# EAGLE design tranc_1c (EAGLE 6.5.0)
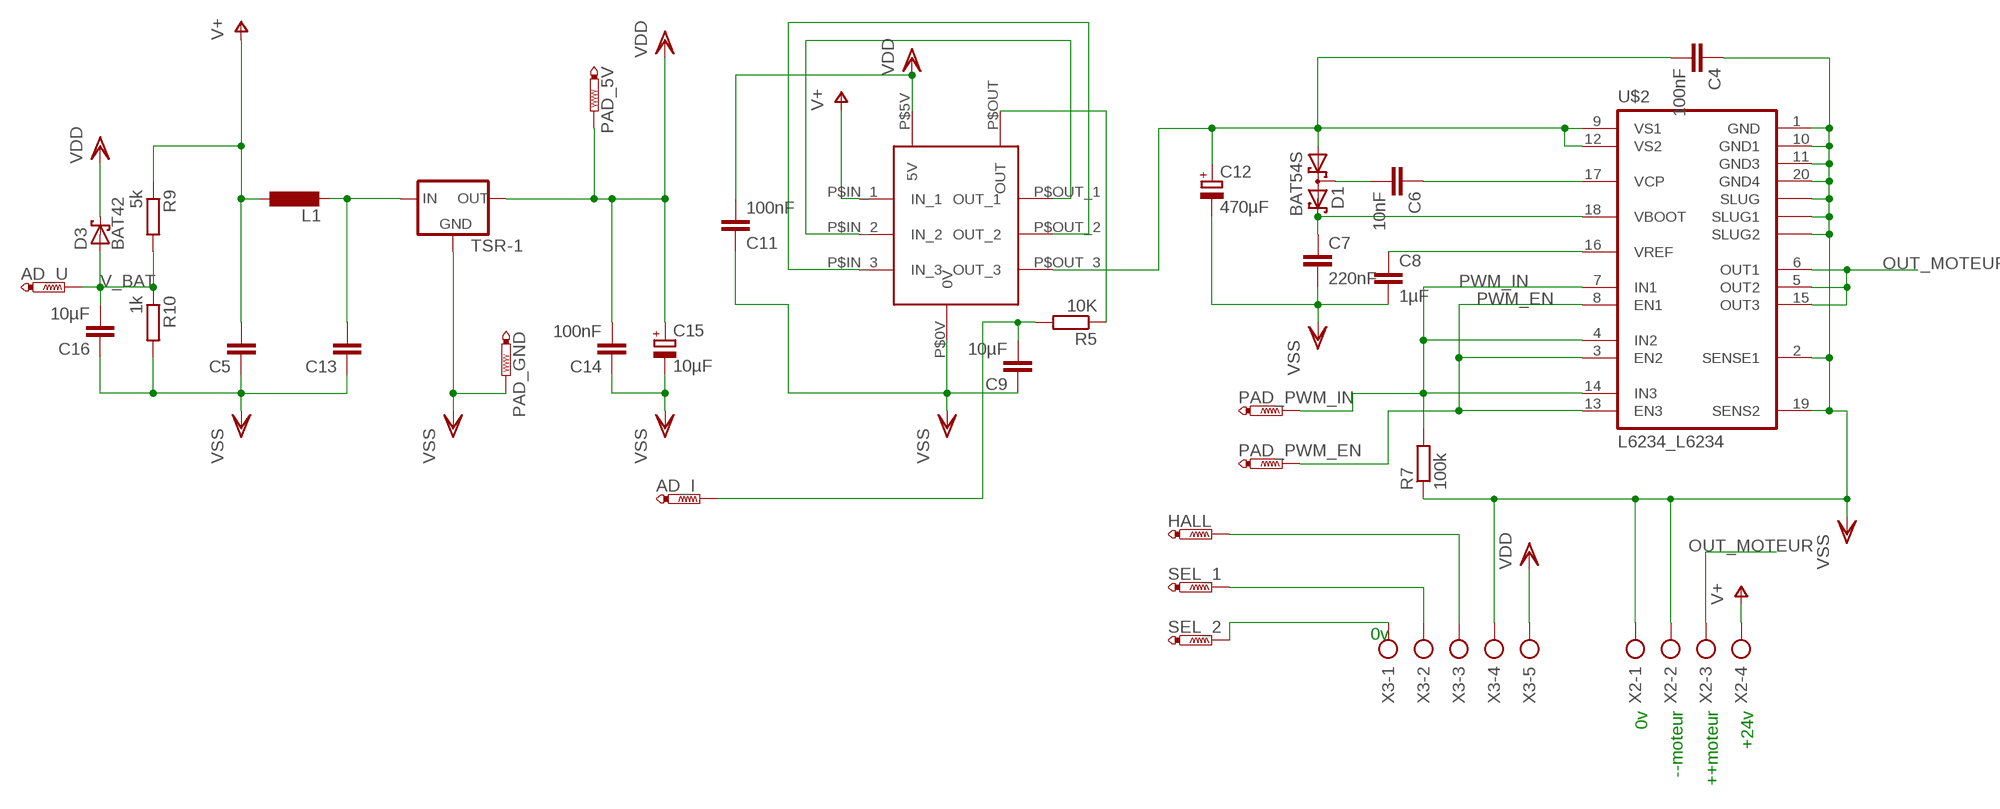
[diagram p0: schematic, sheet 1]

## Parts
AD_I  PTR1TP20SQ  [TP20SQ]
AD_U  PTR1TP20SQ  [TP20SQ]
C4  100nF  C-EUC0805K  [C0805K]
C5  C-EUC1206K  [C1206K]
C6  10nF  C-EUC0805K  [C0805K]
C7  220nF  C-EUC0805K  [C0805K]
C8  1µF  C-EUC0805K  [C0805K]
C9  10µF  C-EUC1812  [C1812]
C11  100nF  C-EUC0805K  [C0805K]
C12  470µF  CPOL-EUTT5D11L  [TT5D11L]
C13  C-EUC1206K  [C1206K]
C14  100nF  C-EUC0805K  [C0805K]
C15  10µF  CPOL-EUSMCB  [SMC_B]
C16  10µF  C-EUC0805K  [C0805K]
D1  BAT54S  [SOT23]
D3  BAT42  [DO35-10]
HALL  PTR1TP20SQ  [TP20SQ]
L1  L-EUL2012C  [L2012C]
PAD_5V  PTR1TP20SQ  [TP20SQ]
PAD_GND  PTR1TP20SQ  [TP20SQ]
PAD_PWM_EN  PTR1TP20SQ  [TP20SQ]
PAD_PWM_IN  PTR1TP20SQ  [TP20SQ]
R5  10K  R-EU_M0805  [M0805]
R7  100k  R-EU_M0805  [M0805]
R9  5k  R-EU_M0805  [M0805]
R10  1k  R-EU_M0805  [M0805]
SEL_1  PTR1TP20SQ  [TP20SQ]
SEL_2  PTR1TP20SQ  [TP20SQ]
TSR-1  78XXS  [78XXS]
U$1  LTS25-NP  [LTS25]
U$2  L6234_L6234  [L6234_SO20POWER2]
X2  AK300/4  [AK300/4]
X3  AK300/5  [AK300/5]

## Nets
N$1: C13.2 L1.2 TSR-1.IN
N$2: U$1.P$IN_2(IN_2) U$1.P$OUT_1(OUT_1)
N$3: HALL.TP X3.3
N$4: SEL_1.TP X3.2
N$5: U$1.P$IN_3(IN_3) U$1.P$OUT_2(OUT_2)
N$6: SEL_2.TP X3.1
N$7: C4.2 C12.+ D1.1(A1) U$1.P$OUT_3(OUT_3) U$2.9(VS1) U$2.12(VS2)
N$8: R5.1 U$1.P$OUT(OUT)
N$10: C6.2 D1.3(C1A2)
N$11: C6.1 U$2.17(VCP)
N$12: C7.1 D1.2(C2) U$2.18(VBOOT)
N$13: C8.1 U$2.16(VREF)
N$30: AD_I.TP C9.2 R5.2
OUT_MOTEUR: U$2.5(OUT2) U$2.6(OUT1) U$2.15(OUT3) X2.3
PWM_EN: PAD_PWM_EN.TP U$2.3(EN2) U$2.8(EN1) U$2.13(EN3)
PWM_IN: PAD_PWM_IN.TP R7.2 U$2.4(IN2) U$2.7(IN1) U$2.14(IN3)
V+: C5.2 L1.1 R9.1 U$1.P$IN_1(IN_1) X2.4
V_BAT: AD_U.TP C16.2 D3.A R9.2 R10.1
VDD: C11.2 C14.2 C15.+ D3.C PAD_5V.TP TSR-1.OUT U$1.P$5V(5V) X3.5
VSS: C4.1 C5.1 C7.2 C8.2 C9.1 C11.1 C12.- C13.1 C14.1 C15.- C16.1 PAD_GND.TP R7.1 R10.2 TSR-1.GND U$1.P$0V(0V) U$2.1(GND) U$2.2(SENSE1) U$2.10(GND1) U$2.11(GND3) U$2.19(SENS2) U$2.20(GND4) U$2.SLUG1(SLUG2) U$2.SLUG2(SLUG) U$2.SLUG(SLUG1) X2.1 X2.2 X3.4

## Notes on the sheet
- 0v
- 0v | --moteur | ++moteur | +24v

## Library data of the parts
AD_I AD_U HALL PAD_5V PAD_GND PAD_PWM_EN PAD_PWM_IN SEL_1 SEL_2 = testpad:PTR1: TEST PIN
C4-C9 C11 C13 C14 C16 = rcl:C-EU: CAPACITOR, European symbol
C12 C15 = rcl:CPOL-EU: POLARIZED CAPACITOR, European symbol
D1 = diode:BAT54S: Schottky Diodes Pin connection corrected 2011-05-04 Source: Fairchild .. BAT54.pdf
D3 = diode:BAT42: DIODE barrier diode
L1 = rcl:L-EU: INDUCTOR, European symbol
R5 R7 R9 R10 = rcl:R-EU_: RESISTOR, European symbol
TSR-1 = v-reg:78XXS: VOLTAGE REGULATOR
U$1 = lem:LTS25-NP
U$2 = 009:L6234_L6234
X2 = con-ptr500:AK300/4: CONNECTOR; OC_FARNELL: unknown; OC_NEWARK: unknown
X3 = con-ptr500:AK300/5: CONNECTOR; OC_FARNELL: unknown; OC_NEWARK: unknown

## Board
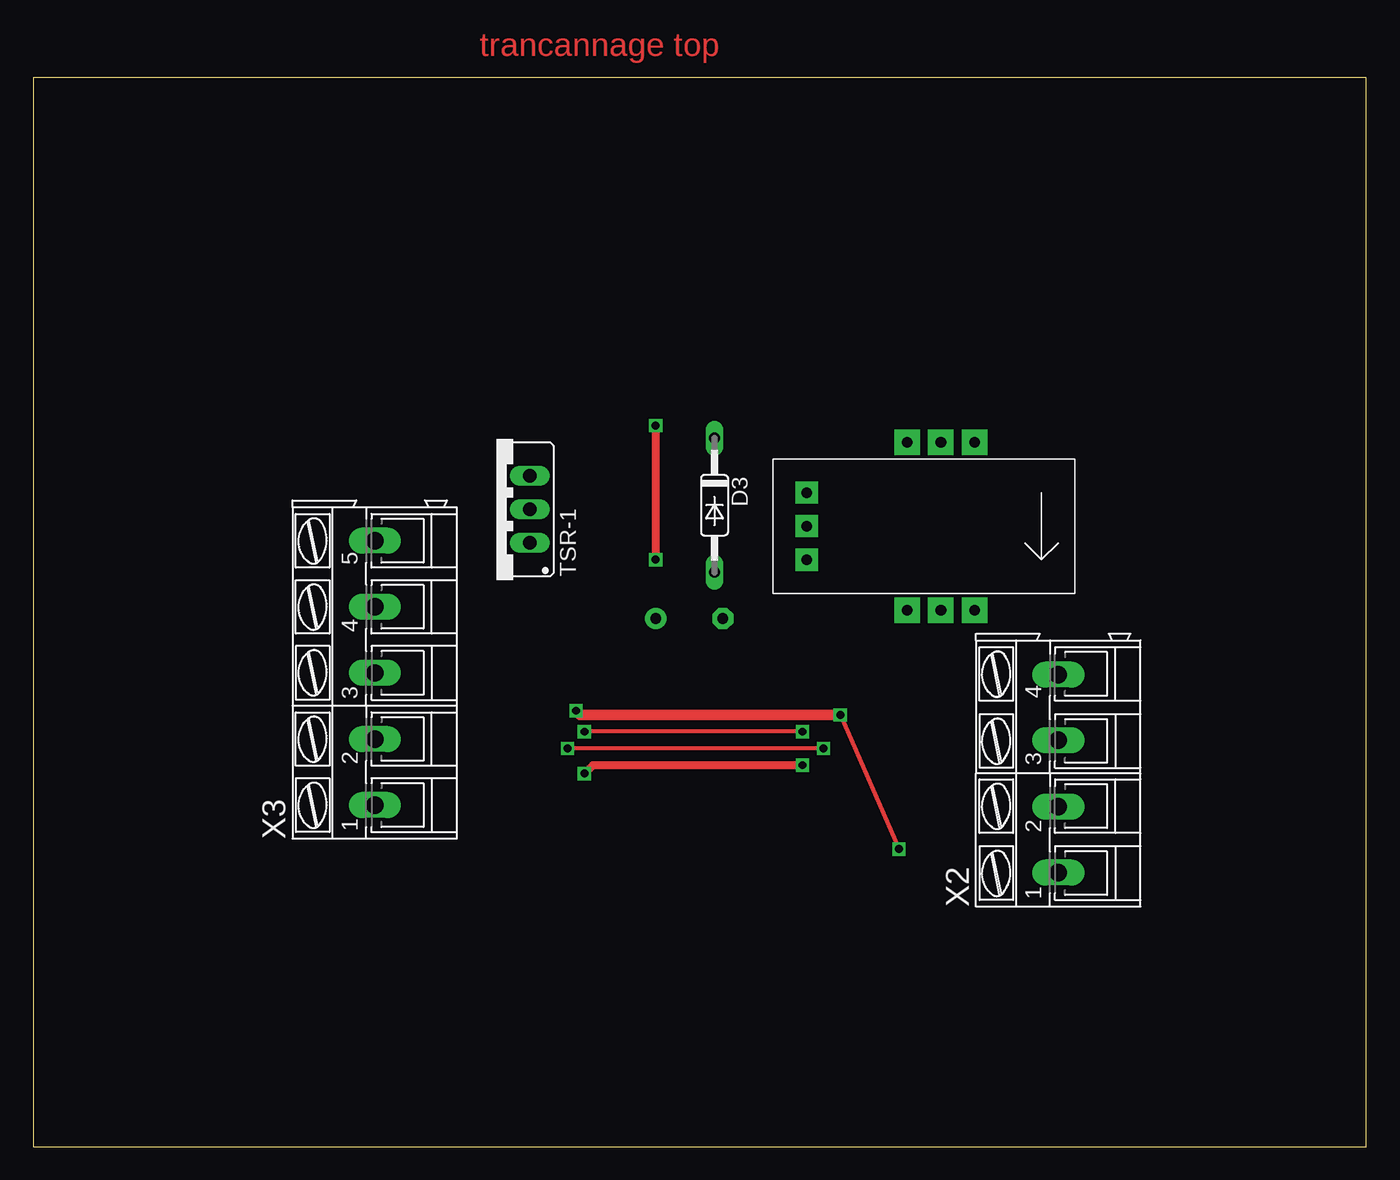
[diagram p1: board, top side]
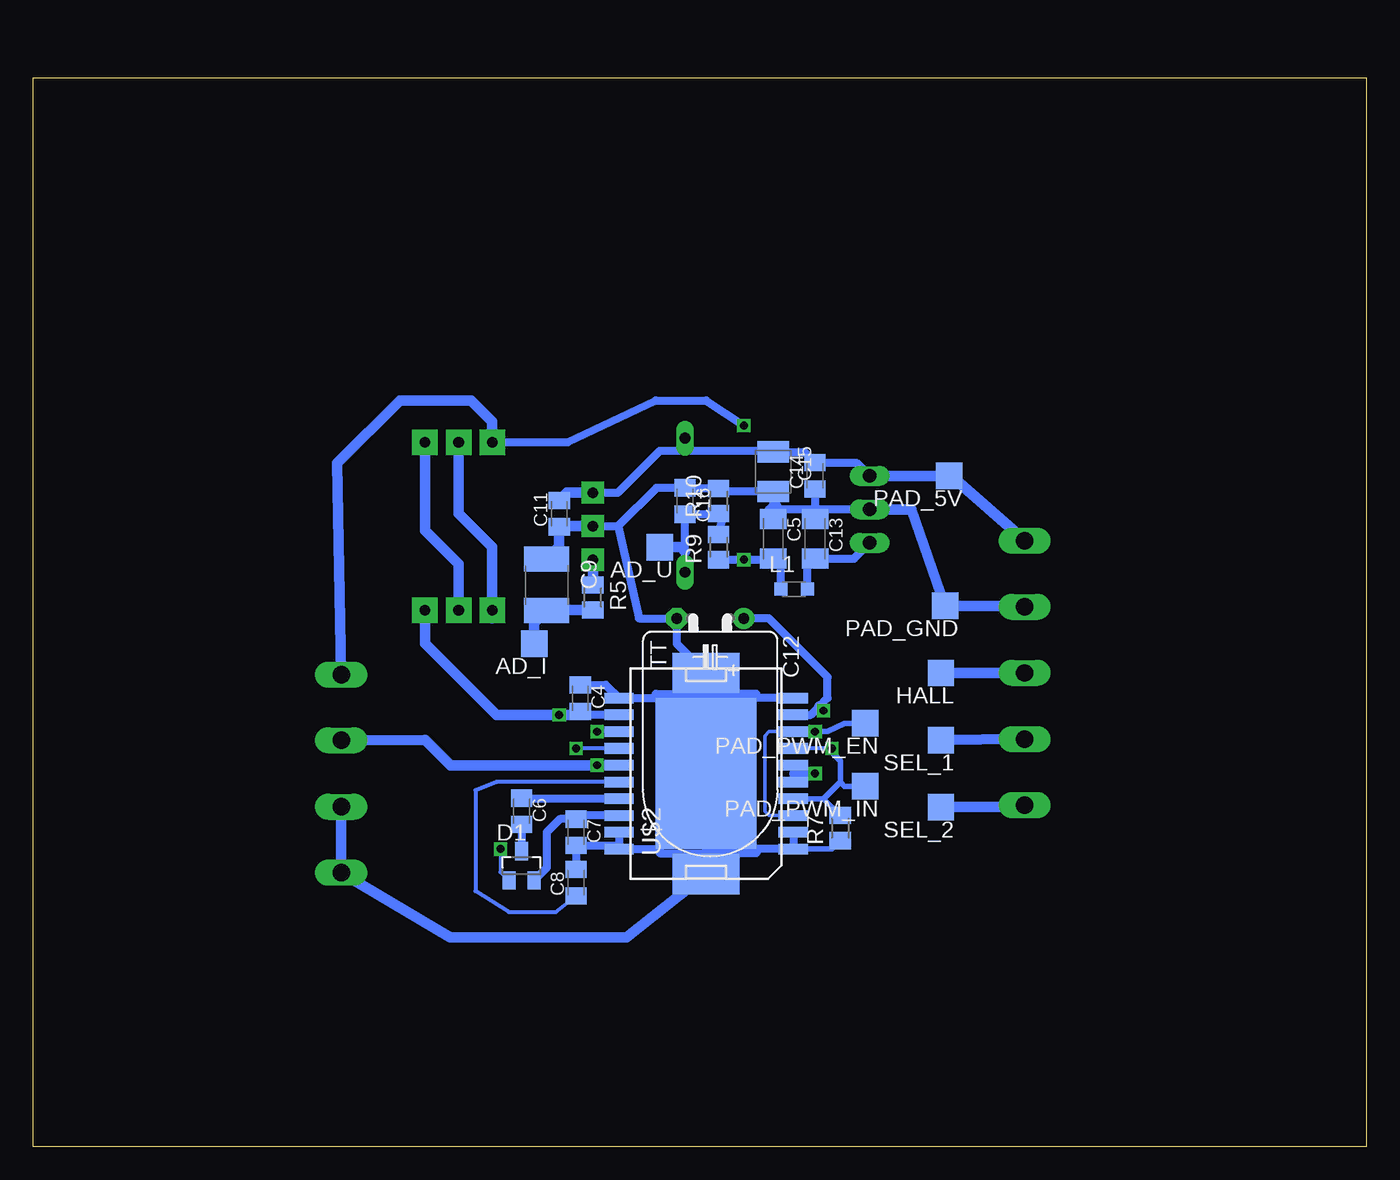
[diagram p2: board, bottom side, seen from below]

Size 100.95 x 80.95 mm. Coordinates in mm from the lower left corner, seen from the top.
Outline: 0,0 100.95,0 100.95,80.95 0,80.95 0,0
Copper layers (1*16): Top 0.035mm / dielectric 1.5mm / Bottom 0.035mm
Design rules "default": minimum track width 10mil, minimum drill 24mil, track to track 8mil, track to pad 8mil, pad to pad 8mil, via to via 8mil, smd to smd 8mil, copper to edge 40mil, drill to drill 8mil, minimum pad ring 10mil, minimum via ring 8mil, stop-mask expansion 4mil, vias tented up to drill 0mil, thermal gap 10mil

### Footprints (pad centres in the part's own frame; a part is rotated, then mirrored left to right if it is on the bottom)
TP20SQ = smd 2 x 2: TP 0,0
C0805K = smd 1.3 x 1.6: 1 -1,0; 2 1,0
C1206K = smd 1.5 x 2: 1 -1.5,0; 2 1.5,0
C1812 = smd 1.9 x 3.4: 1 -1.95,0; 2 1.95,0
TT5D11L = drill 0.813 pad 1.6: + -2.54,0 | drill 0.813 pad 1.6 octagon: - 2.54,0
SMC_B = smd 1.6 x 2.4: + -1.5,0; - 1.5,0
SOT23 = smd 1 x 1.4: 1 -0.95,-1.1; 2 0.95,-1.1; 3 0,1.1
DO35-10 = drill 0.813 long: A 5.08,0; C -5.08,0
L2012C = smd 1 x 1: 1 -1,0; 2 1,0
M0805 = smd 1.3 x 1.6: 1 -0.95,0; 2 0.95,0
78XXS = drill 1.016 long: GND 0,-2.54; IN -2.54,-2.54; OUT 2.54,-2.54
LTS25 = drill 0.8 pad 1.676 square: P$0V -10.16,0; P$5V -10.16,2.54; P$OUT -10.16,-2.54 | drill 0.8 pad 1.93 square: P$IN_1 -2.54,6.35; P$IN_2 0,6.35; P$IN_3 2.54,6.35; P$OUT_1 -2.54,-6.35; P$OUT_2 0,-6.35; P$OUT_3 2.54,-6.35
L6234_SO20POWER2 = smd 0.8 x 2.2: 1 -5.715,-6.6; 2 -4.445,-6.6; 3 -3.175,-6.6; 4 -1.905,-6.6; 5 -0.635,-6.6; 6 0.635,-6.6; 7 1.905,-6.6; 8 3.175,-6.6; 9 4.445,-6.6; 10 5.715,-6.6; 11 5.715,6.6; 12 4.445,6.6; 13 3.175,6.6; 14 1.905,6.6; 15 0.635,6.6; 16 -0.635,6.6; 17 -1.905,6.6; 18 -3.175,6.6; 19 -4.445,6.6; 20 -5.715,6.6 | smd 3.048 x 5.08: SLUG -7.62,0; SLUG2 7.62,0 | smd 11.43 x 7.62: SLUG1 0,0
AK300/4 = drill 1.321 long: 1 -7.493,0; 2 -2.515,0; 3 2.515,0; 4 7.493,0
AK300/5 = drill 1.321 long: 1 -10.008,0; 2 -5.004,0; 3 0,0; 4 5.004,0; 5 10.008,0

### Placement (x,y rotation side)
AD_I  63.02,38.1 180 bottom
AD_U  53.49,45.4 180 bottom
C4  59.52,33.97 270 bottom
C5  44.92,46.03 270 bottom
C6  63.97,25.39 270 bottom
C7  59.84,23.81 270 bottom
C8  59.84,20 90 bottom
C9  62.06,42.54 270 bottom
C11  61.11,47.94 90 bottom
C12  49.68,40 180 bottom
C13  41.74,46.03 270 bottom
C14  41.74,50.8 90 bottom
C15  44.92,51.11 270 bottom
C16  51.59,48.89 270 bottom
D1  63.97,21.27 0 bottom
D3  51.59,48.57 270 top
HALL  32.22,35.87 180 bottom
L1  43.33,42.22 0 bottom
PAD_5V  31.58,50.8 180 bottom
PAD_GND  31.9,40.95 180 bottom
PAD_PWM_EN  37.94,32.06 180 bottom
PAD_PWM_IN  37.94,27.3 180 bottom
R5  58.57,41.59 270 bottom
R7  39.84,24.12 90 bottom
R9  49.05,45.4 90 bottom
R10  49.05,48.89 90 bottom
SEL_1  32.22,30.79 180 bottom
SEL_2  32.22,25.71 180 bottom
TSR-1  35.08,48.26 90 top
U$1  68.73,46.98 0 top
U$2  50,28.25 90 bottom
X2  77.62,28.25 90 top
X3  25.87,35.87 90 top

### Tracks (layer width: path | path; a pad name or v marks a point on that pad's centre or on a via)
N$1
  Bottom 0.61: TSR-1.IN 38.8,44.53 C13.2 42.33,43.95 L1.2
N$2
  Bottom 0.813: U$1.P$IN_2 68.73,47.94 66.19,45.4 U$1.P$OUT_1 66.19,40
N$3
  Bottom 0.813: HALL.TP X3.3
N$4
  Bottom 0.813: SEL_1.TP 32.46,30.79 X3.2
N$5
  Bottom 0.813: U$1.P$IN_3 71.27,46.67 68.73,44.13 U$1.P$OUT_2
N$6
  Bottom 0.813: SEL_2.TP 25.08,25.71 X3.1
N$7  (via drill 0.6)
  Top 0.305: v61.11,32.7 v65.56,22.54
  Top 0.813: v61.11,32.7 41.43,32.7 v41.11,33.02
  Bottom 0.305: v65.56,22.54 65.56,20.8 D1.1
  Bottom 0.61: U$2.12 59.25,32.7 C4.2 | U$2.9 42.06,32.7 41.43,33.33 40.79,33.97 40.79,35.55 45.24,40 C12.+
  Bottom 0.813: 59.25,32.7 v61.11,32.7 65.88,32.7 71.27,38.1 U$1.P$OUT_3 | v41.11,33.02 41.43,33.33
N$8
  Bottom 0.813: U$1.P$OUT R5.1
N$10
  Bottom 0.61: C6.2 D1.3
N$11
  Bottom 0.61: U$2.17 63.97,26.35 C6.1
N$12
  Bottom 0.61: U$2.18 59.57,25.08 C7.1 61.06,24.81 62.06,23.81 62.06,21.12 D1.2
N$13
  Bottom 0.305: U$2.16 65.88,27.62 67.46,26.98 67.46,19.36 64.92,17.77 61.38,17.77 C8.1
N$30
  Bottom 0.813: R5.2 62.02,40.64 C9.2 63.02,39.64 AD_I.TP
OUT_MOTEUR  (via drill 0.6)
  Top 0.61: v58.25,28.89 42.38,28.89 v41.74,28.25
  Bottom 0.61: U$2.6 43.4,28.25 | 43.4,28.25 U$2.5 | U$2.15 v58.25,28.89 | v41.74,28.25 43.4,28.25
  Bottom 0.813: X2.3 71.27,30.79 69.34,28.86 58.28,28.86 v58.25,28.89
PWM_EN  (via drill 0.6)
  Top 0.305: v58.25,31.43 v41.74,31.43
  Bottom 0.254: U$2.3 45.24,25.08 45.55,25.39 45.55,31.11 45.24,31.43 U$2.8
  Bottom 0.305: U$2.13 v58.25,31.43 | v41.74,31.43 U$2.8
  Bottom 0.406: v41.74,31.43 40.79,31.43 39.52,32.06 PAD_PWM_EN.TP
PWM_IN  (via drill 0.6)
  Top 0.305: v59.84,30.16 v40.48,30.16
  Bottom 0.305: U$2.14 v59.84,30.16 | U$2.7 v40.48,30.16 40.48,29.84
  Bottom 0.406: U$2.4 41.11,26.35 | 41.11,26.35 R7.2 | 40.48,29.84 39.84,29.2 39.84,27.62 | 39.84,27.62 41.11,26.35 | PAD_PWM_IN.TP 39.52,27.3 39.84,27.62
V+  (via drill 0.6)
  Top 0.61: v47.14,54.61 v47.14,44.45
  Bottom 0.61: R9.1 v47.14,44.45 45,44.45 C5.2 44.33,43.95 L1.1 | U$1.P$IN_1 60.48,53.34 53.81,56.51 50,56.51 v47.14,54.61
  Bottom 0.813: X2.4 77.94,51.75 73.18,56.51 67.78,56.51 66.19,54.92 U$1.P$IN_1
V_BAT
  Bottom 0.61: R9.2 48.73,47.62 R10.1 49.1,47.89 C16.2 51.59,45.08 D3.A
  Bottom 0.813: AD_U.TP 51.91,45.4 51.59,45.08
VDD
  Bottom 0.61: 37.94,51.11 TSR-1.OUT 38.62,51.8 C14.2 42.56,52.61 C15.+ 45.01,52.7 51.59,52.7 | U$1.P$5V 56.67,49.53 53.49,52.7 51.59,52.7 | D3.C 51.59,52.7
  Bottom 0.813: U$1.P$5V 60.52,49.53 C11.2 | TSR-1.OUT PAD_5V.TP 31.42,50.8 X3.5
VSS
  Bottom 0.406: U$2.1 40.48,22.54 R7.1
  Bottom 0.61: U$2.19 U$2.20 | U$2.2 U$2.1 46.19,22.54 46.19,22.22 50,22.22 | U$2.20 53.49,22.54 53.49,22.22 50,22.22 | 50,22.22 U$2.SLUG | 50,34.29 53.81,34.29 53.81,33.97 U$2.11 57.6,34.97 C4.1 | U$2.10 46.51,33.97 46.19,34.29 50,34.29 | 50,34.29 U$2.SLUG2 52.22,38.1 C12.- 55.08,40 56.67,46.98 | U$2.20 56.87,22.81 C7.2 C8.2 | 50,22.22 U$2.SLUG1 50,34.29 | U$1.P$0V 56.67,46.98 | TSR-1.GND 41.74,48.26 | 41.74,48.26 44.6,48.26 | 44.6,48.26 44.92,48.57 | C5.1 44.92,47.94 44.6,48.26 | C13.1 41.74,48.26 | C14.1 41.74,48.26 | 44.92,48.57 C15.- 48.82,49.61 R10.2 49.1,49.89 C16.1 53.76,49.89 56.67,46.98 | 44.92,48.57 45.24,48.26 44.92,48.26 44.6,48.57 44.92,48.57
  Bottom 0.813: U$2.SLUG 56.03,15.87 69.37,15.87 77.11,20.44 X2.1 X2.2 | U$1.P$0V 61.06,46.98 C11.1 61.11,45.44 C9.1 | TSR-1.GND 34.44,48.26 PAD_GND.TP 25.63,40.95 X3.4

### Text on the board
Top: trancannage top
Bottom: trancannage bottom